# Altium schematic sheet Power-Sheet.SchDoc (part 3 of 3)
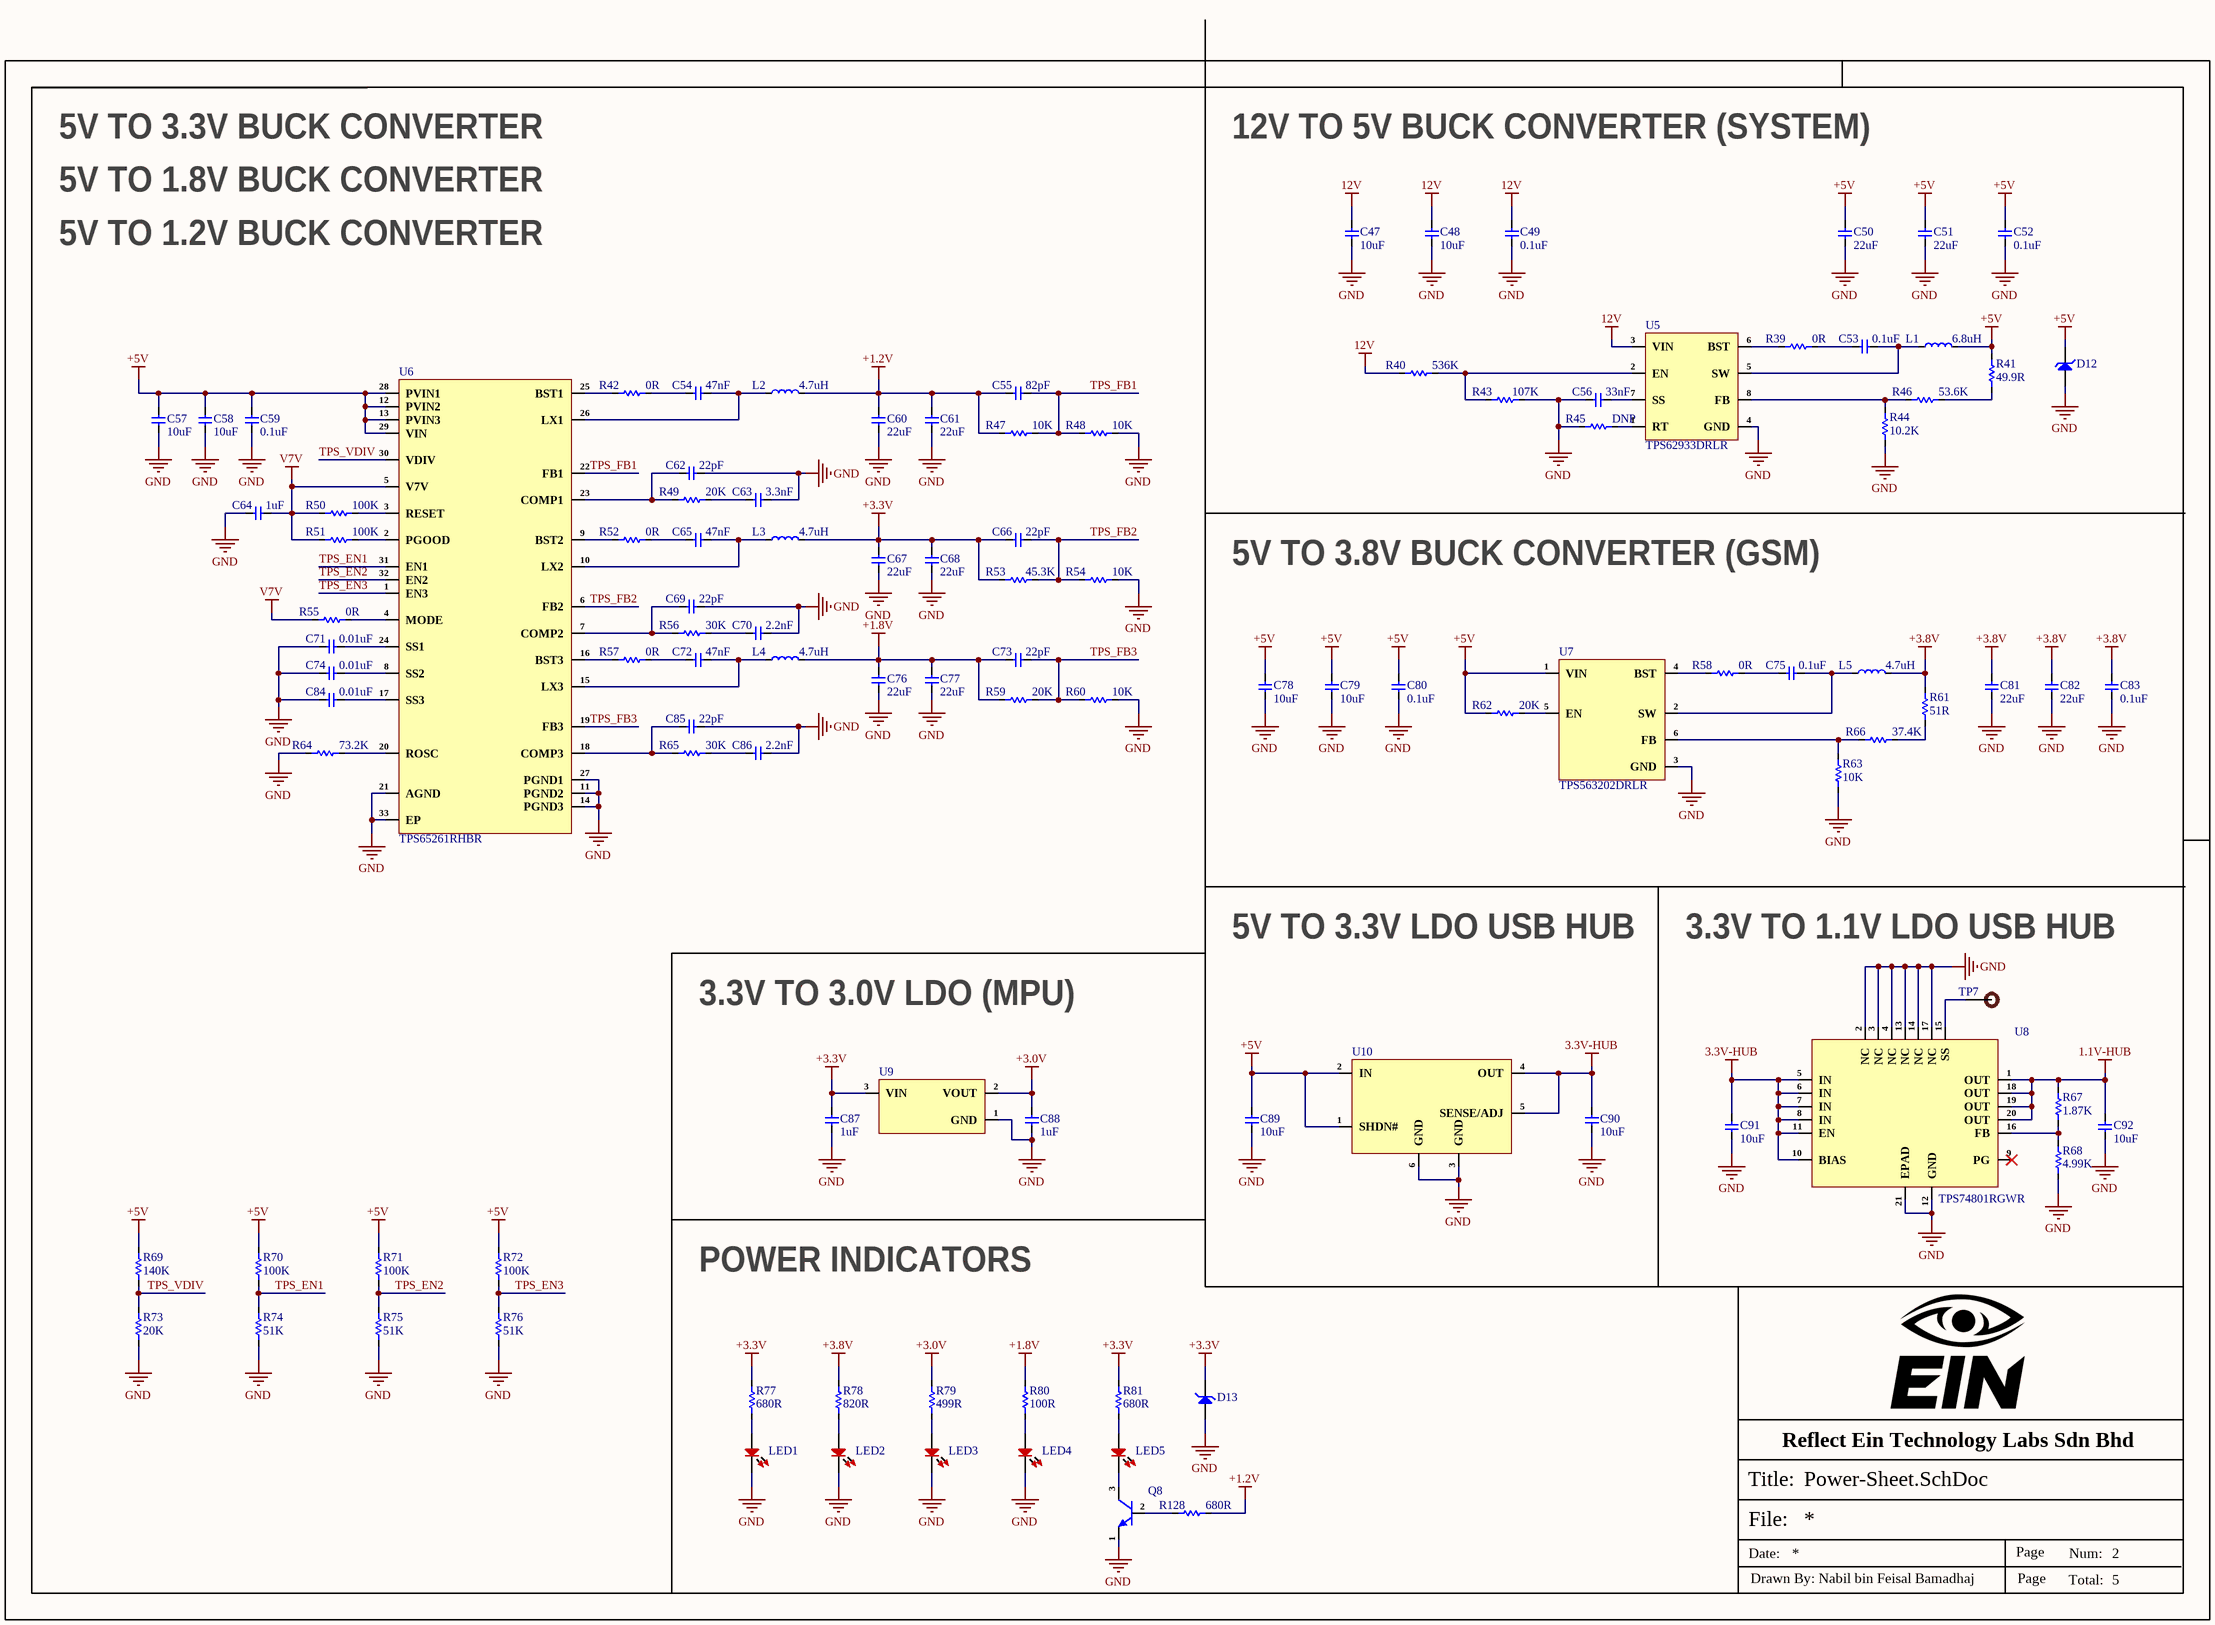
[diagram p2: Power-Sheet.SchDoc]

## Library data of the parts (continued)
R74-R76 = RC0603FR-0751KL: RES 51K OHM 1% 1/10W 0603; Manufacturer: Yageo; Item Type: Resistors; Value: 51kR; Power Rating: 100mW; Voltage Rating: 50V; Temperature Coefficient: 100ppm/°C; Supplier: Future Electronics; LCSC Part Number: C107231; Manufacturer Part Number: RC0603FR-0751KL; RoHS: Yes; Stock: 1155000; Pricing: 5000=0.0024, 50000=0.0023, 150000=0.0022, 375000=0.0021, 1000000=0.002 (USD); Case/Package: 0603; Pins: 2NUMBER; Case Code (Imperial): 0603; Case Code (Metric): 1608; Min Operating Temperature: -55°C; Max Operating Temperature: 155°C; Tolerance: 1%; Packaging: Tape and Reel; Package Quantity: 1; Termination: SMD/SMT; Resistor Type: Thick Film; Number of Terminations: 2; Max Power Dissipation: 100mW; Features: Moisture Resistant; Series: RC; Resistance Tolerance: 1%; Technology: THICK FILM; Voltage Rating (DC): 50V; Length: 1.6mm; Width: 0.031inch; Height: 0.45mm; Depth: 0.8mm; Reach SVHC Compliant: No; RoHS Compliant: Yes; Lead Free: 5697LeadFree; ComponentLink1URL: https://datasheet.ciiva.com/11819/0900766b80f96399-11819378.pdf?src-supplier=Rs; ComponentLink1Description: https://datasheet.ciiva.com/11819/0900766b80f96399-11819378.pdf?src-supplier=Rs; ComponentLink2URL: https://datasheet.ciiva.com/46395/443971-46395014.pdf?src-supplier=Element14; ComponentLink2Description: https://datasheet.ciiva.com/46395/443971-46395014.pdf?src-supplier=Element14; ComponentLink3URL: https://datasheet.ciiva.com/2454/pyu-r-int-thick-7-2454124.pdf?src-supplier=Digikey; ComponentLink3Description: https://datasheet.ciiva.com/2454/pyu-r-int-thick-7-2454124.pdf?src-supplier=Digikey; ComponentLink4URL: https://datasheet.ciiva.com/2454/pyu-r-int-thick-7-2454125.pdf?src-supplier=Digikey; ComponentLink4Description: https://datasheet.ciiva.com/2454/pyu-r-int-thick-7-2454125.pdf?src-supplier=Digikey; ComponentLink5URL: https://datasheet.ciiva.com/2454/pyu-r-int-thick-7-2454123.pdf?src-supplier=Digikey; ComponentLink5Description: https://datasheet.ciiva.com/2454/pyu-r-int-thick-7-2454123.pdf?src-supplier=Digikey; ComponentLink6URL: https://datasheet.ciiva.com/12558/rc0603-272842-12558554.pdf?src-supplier=Mouser; ComponentLink6Description: https://datasheet.ciiva.com/12558/rc0603-272842-12558554.pdf?src-supplier=Mouser
R77 R81 R128 = RC0603FR-07680RL: RES SMD 680 OHM 1% 1/10W 0603; Manufacturer: Yageo; Item Type: Resistor; Manufacturer Part Number: RC0603FR-07680RL; Package: 0603; ComponentLink4URL: https://www.lcsc.com/product-detail/Chip-Resistor-Surface-Mount_YAGEO-RC0603FR-07680RL_C112310.html; ComponentLink4Description: LCSC; LCSC Part Number: C112310
R78 = RC0603FR-07820RL: RES 820 OHM 1% 1/10W 0603; Manufacturer: Yageo; Power Rating: 100mW; Voltage Rating: 75V; Voltage Rating (DC): 50V; Temperature Coefficient: 100ppm/°C; Item Type: Resistor; Supplier 1: Future Electronics; Manufacturer Part Number: RC0603FR-07820RL; RoHS: Yes; Category: Chip SMD Resistors; Stock 1: 415000; Pricing 1: 5000=0.002, 50000=0.0014, 100000=0.0018, 200000=0.0014, 375000=0.0018, 625000=0.0013, 1000000=0.0017, 2000000=0.0012, 3750000=0.0016 (USD); Case/Package: 0603; Pins: 2; Case Code (Imperial): 0603; Case Code (Metric): 1608; Weight: 7.1E-05oz; Min Operating Temperature: -55°C; Max Operating Temperature: 155°C; Tolerance: 1%; Value: 820R; Packaging: Tape and Reel; Termination: SMD/SMT; Resistor Type: Thick Film; Features: Moisture Resistant; Series: RC; Max Power Dissipation: 100mW; Number of Terminations: 2; Construction: Rectangular; Resistance Tolerance: 1%; Technology: THICK FILM; Length: 1.6mm; Width: 0.8mm; Height: 0.45mm; Depth: 0.8mm; Military Standard: Not; Lead Free: Lead Free; RoHS Compliant: Yes; Reach SVHC Compliant: Unknown; ComponentLink1URL: http://www.farnell.com/datasheets/1868787.pdf?src-supplier=Farnell; ComponentLink1Description: http://www.farnell.com/datasheets/1868787.pdf?src-supplier=Farnell; ComponentLink2URL: http://www.mouser.com/ds/2/447/RC0603-272842.pdf?src-supplier=Mouser; ComponentLink2Description: http://www.mouser.com/ds/2/447/RC0603-272842.pdf?src-supplier=Mouser; ComponentLink3URL: http://www.farnell.com/datasheets/2167052.pdf?src-supplier=Farnell; ComponentLink3Description: http://www.farnell.com/datasheets/2167052.pdf?src-supplier=Farnell; ComponentLink4URL: https://www.verical.com/server-webapp/html/getDatasheet?partID=358925&src-supplier=Verical; ComponentLink4Description: https://www.verical.com/server-webapp/html/getDatasheet?partID=358925&src-supplier=Verical; ComponentLink5URL: http://www.farnell.com/datasheets/1868787.pdf?src-supplier=Newark; ComponentLink5Description: http://www.farnell.com/datasheets/1868787.pdf?src-supplier=Newark; ComponentLink6URL: http://www.farnell.com/datasheets/1868787.pdf?src-supplier=Element14; ComponentLink6Description: http://www.farnell.com/datasheets/1868787.pdf?src-supplier=Element14; ComponentLink7URL: http://www.yageo.com/documents/recent/PYu-RC_Group_51_RoHS_L_10.pdf?src-supplier=Digi-Key; ComponentLink7Description: http://www.yageo.com/documents/recent/PYu-RC_Group_51_RoHS_L_10.pdf?src-supplier=Digi-Key; ComponentLink8URL: http://www.yageo.com/documents/recent/PYu-RC_Group_51_RoHS_L_9.pdf?src-supplier=Digi-Key; ComponentLink8Description: http://www.yageo.com/documents/recent/PYu-RC_Group_51_RoHS_L_9.pdf?src-supplier=Digi-Key; ComponentLink9URL: http://www.farnell.com/datasheets/2167052.pdf?src-supplier=Newark; ComponentLink9Description: http://www.farnell.com/datasheets/2167052.pdf?src-supplier=Newark; ComponentLink10URL: http://www.yageo.com/documents/recent/PYu-RC0603_51_RoHS_L_7.pdf?src-supplier=Future+Electronics; ComponentLink10Description: http://www.yageo.com/documents/recent/PYu-RC0603_51_RoHS_L_7.pdf?src-supplier=Future+Electronics; Supplier Part Number 1: 8621260; LCSC Part Number: C114638
R79 = RC0603FR-07499RL: RES 499 OHM 1% 1/10W 0603; Manufacturer: Yageo; Temperature Coefficient: 100ppm/°C; Power Rating: 100mW; Voltage Rating: 50V; Supplier 1: RSComponents; Manufacturer Part Number: RC0603FR-07499RL; RoHS: Yes; Category: Chip SMD Resistors; Stock 1: 900; Pricing 1: 5000=0.00300, 10000=0.00300, 15000=0.00300, 20000=0.00200 (GBP); Mount: Surface Mount; Case/Package: 0603; Contact Plating: Tin,Matte; Case Code (Metric): 1608; Case Code (Imperial): 0603; Size Code: 0603; Min Operating Temperature: -55°C; Max Operating Temperature: 155°C; Resistance: 499R; Tolerance: 1%; Resistor Type: Thick Film; Package Quantity: 1; Packaging: Tape and Reel; Number of Terminations: 2; Termination: SMD/SMT; Max Power Dissipation: 100mW; Voltage Rating (DC): 50V; Features: Moisture Resistant; Series: RC; Construction: Rectangular; Technology: THICK FILM; Length: 1.6mm; Width: 0.031inch; Height: 0.45mm; Depth: 0.8mm; Radiation Hardening: No; Military Standard: Not; Lead Free: Lead Free; RoHS Compliant: Yes; ComponentLink1URL: https://datasheet.ciiva.com/11808/0900766b80f96399-11808558.pdf?src-supplier=RSComponents; ComponentLink1Description: https://datasheet.ciiva.com/11808/0900766b80f96399-11808558.pdf?src-supplier=RSComponents; ComponentLink2URL: https://datasheet.ciiva.com/2453/pyu-r-int-thick-7-2453956.pdf?src-supplier=Digi-Key; ComponentLink2Description: https://datasheet.ciiva.com/2453/pyu-r-int-thick-7-2453956.pdf?src-supplier=Digi-Key; ComponentLink3URL: https://datasheet.ciiva.com/2453/pyu-r-int-thick-7-2453957.pdf?src-supplier=Digi-Key; ComponentLink3Description: https://datasheet.ciiva.com/2453/pyu-r-int-thick-7-2453957.pdf?src-supplier=Digi-Key; ComponentLink4URL: https://datasheet.ciiva.com/2453/pyu-r-int-thick-7-2453955.pdf?src-supplier=Digi-Key; ComponentLink4Description: https://datasheet.ciiva.com/2453/pyu-r-int-thick-7-2453955.pdf?src-supplier=Digi-Key; ComponentLink5URL: https://datasheet.ciiva.com/12558/rc0603-272842-12558391.pdf?src-supplier=Mouser; ComponentLink5Description: https://datasheet.ciiva.com/12558/rc0603-272842-12558391.pdf?src-supplier=Mouser; ComponentLink6URL: https://datasheet.ciiva.com/8885/pyu-rc0603-51-rohs-l-4-8885483.pdf?src-supplier=Avnet; ComponentLink6Description: https://datasheet.ciiva.com/8885/pyu-rc0603-51-rohs-l-4-8885483.pdf?src-supplier=Avnet; Supplier Part Number 1: 1995585; LCSC Part Number: C137714
R80 = RC0603FR-07100RL: RES SMD 100 OHM 1% 1/10W 0603; Manufacturer: Yageo; Temperature Coefficient: 100ppm/°C; Voltage Rating (DC): 50V; Power Rating: 100mW; Item Type: Resistor; Supplier 1: Arrow Electronics; Manufacturer Part Number: RC0603FR-07100RL; RoHS: Yes; Category: Chip SMD Resistors; Stock 1: 3800000; Pricing 1: 5000=0.00300, 5000=0.00200, 5000=0.00450, 50000=0.00410, 500000=0.00230, 2500000=0.00140 (USD); Case/Package: 0603; Number of Pins: 2; Case Code (Imperial): 0603; Case Code (Metric): 1608; Size Code: 0603; Min Operating Temperature: -55°C; Max Operating Temperature: 155°C; Resistance: 100R; Tolerance: 1%; Resistor Type: Thick Film; Packaging: Tape and Reel; Voltage Rating: 50V; Termination: SMD/SMT; Features: Moisture Resistant; Series: RC; Max Power Dissipation: 100mW; Number of Terminations: 2; Construction: Rectangular; Resistance Tolerance: 1%; Technology: THICK FILM; Length: 1.6mm; Width: 0.8mm; Height: 0.45mm; Depth: 0.8mm; REACH SVHC: Unknown; Lead Free: Lead Free; RoHS Compliant: Yes; Military Standard: Not; Supplier Part Number 1: RC0603FR-07100RL; LCSC Part Number: C105588
TP7 = TEST POINT 0.5mm Dia: Test Point ON; Item Type: Test Point; Manufacturer Part Number: TEST POINT 0.5mm Dia
U5 = TPS62933DRLR: IC REG BUCK ADJ 3A SOT583; Manufacturer: Texas Instruments; Supplier: Mouser; Supplier Part Number: 595-TPS62933DRLR; Manufacturer Part Number: TPS62933DRLR; RoHS: No; Category: Voltage Regulators - Switching; Stock: 5259; Pricing: 1=0.7, 10=0.581, 50=0.581, 100=0.44, 1000=0.297, 10000=0.241 (USD); LCSC Part Number: C3200405; Item Type: IC
U6 = TPS65261RHBR: IC REG BCK ADJ 3A/2A TRPL 32VQFN; Manufacturer: Texas Instruments; Supplier: Mouser; LCSC Part Number: C138722; Manufacturer Part Number: TPS65261RHBR; RoHS: Yes; Item Type: IC; Stock: 3449; Pricing: 1=2.78, 10=1.91, 50=1.91, 100=1.71, 1000=1.52, 10000=1.32 (USD); ComponentLink1URL: https://datasheet.ciiva.com/29735/tps65261-1-29735186.pdf?src-supplier=Digikey; ComponentLink1Description: https://datasheet.ciiva.com/29735/tps65261-1-29735186.pdf?src-supplier=Digikey
U7 = TPS563202DRLR: IC REG BUCK ADJ 3A SOT563; Manufacturer: Texas Instruments; Number of Channels: 1NUMBER; Supplier: Mouser; LCSC Part Number: C1513007; Manufacturer Part Number: TPS563202DRLR; RoHS: Yes; Item Type: IC; Stock: 5123; Pricing: 1=0.29, 10=0.174, 50=0.174, 100=0.131, 1000=0.125, 10000=0.109 (USD); Pins: 6NUMBER; Length: 1.6mm; Width: 1.2mm; Height: 600um; Thickness: 550um
U8 = TPS74801RGWR: IC REG LIN POS ADJ 1.5A 20VQFN; Manufacturer: Texas Instruments; Supplier: Mouser; LCSC Part Number: C129193; Manufacturer Part Number: TPS74801RGWR; RoHS: Yes; Item Type: IC; Stock: 12482; Pricing: 1=1.87, 10=1.33, 50=1.33, 100=1.19, 1000=1.04, 10000=1.03 (USD); Length: 5mm; Width: 5mm; Height: 1mm; Thickness: 900um; ComponentLink1URL: https://datasheet.ciiva.com/4885/sbvs074j-203573-4885874.pdf?src-supplier=Mouser; ComponentLink1Description: https://datasheet.ciiva.com/4885/sbvs074j-203573-4885874.pdf?src-supplier=Mouser; ComponentLink2URL: https://datasheet.ciiva.com/41462/001015037-da-01-en-ic-reg-ldo-adj-tps74801rgwr-vqfn-20-tid-41462882.pdf?src-supplier=Conrad; ComponentLink2Description: https://datasheet.ciiva.com/41462/001015037-da-01-en-ic-reg-ldo-adj-tps74801rgwr-vqfn-20-tid-41462882.pdf?src-supplier=Conrad; ComponentLink3URL: https://datasheet.ciiva.com/14278/tps74801-14278399.pdf?src-supplier=Avnet; ComponentLink3Description: https://datasheet.ciiva.com/14278/tps74801-14278399.pdf?src-supplier=Avnet; ComponentLink4URL: https://datasheet.ciiva.com/31402/tps74801-31402076.pdf?src-supplier=Farnell; ComponentLink4Description: https://datasheet.ciiva.com/31402/tps74801-31402076.pdf?src-supplier=Farnell; ComponentLink5URL: https://datasheet.ciiva.com/2044/tps74801-2044836.pdf?src-supplier=Digikey; ComponentLink5Description: https://datasheet.ciiva.com/2044/tps74801-2044836.pdf?src-supplier=Digikey; ComponentLink6URL: https://datasheet.ciiva.com/2044/tps74801-2044837.pdf?src-supplier=Digikey; ComponentLink6Description: https://datasheet.ciiva.com/2044/tps74801-2044837.pdf?src-supplier=Digikey; ComponentLink7URL: https://datasheet.ciiva.com/2044/tps74801-2044838.pdf?src-supplier=Digikey; ComponentLink7Description: https://datasheet.ciiva.com/2044/tps74801-2044838.pdf?src-supplier=Digikey
U9 = XC6206P302MR-G: IC REG LINEAR 3V 200MA SOT23; Manufacturer: Torex; Number of Channels: 1NUMBER; Supplier: Mouser; LCSC Part Number: C9972; Manufacturer Part Number: XC6206P302MR-G; RoHS: Yes; Item Type: IC; Stock: 15826; Pricing: 1=0.68, 10=0.543, 50=0.543, 100=0.417, 1000=0.271, 10000=0.214 (USD); Output Voltage: 3V; ComponentLink1URL: https://www.torexsemi.com/file/xc6206/XC6206.pdf?src-supplier=Digikey; ComponentLink1Description: https://www.torexsemi.com/file/xc6206/XC6206.pdf?src-supplier=Digikey; ComponentLink2URL: https://datasheet.octopart.com/XC6206P302MR-G-Torex-datasheet-134531119.pdf?src-supplier=TME; ComponentLink2Description: https://datasheet.octopart.com/XC6206P302MR-G-Torex-datasheet-134531119.pdf?src-supplier=TME
U10 = TPS7A4533DCQR: IC REG LINEAR 3.3V 1.5A SOT223-6; Manufacturer: Texas Instruments; Dropout Voltage: 300mV; Number of Outputs: 1; Max Supply Voltage: 20V; Min Input Voltage: 2.1V; Min Current Limit: 1.6A; Input Bias Current: 1mA; Polarity: Positive; Accuracy: 1%; Output Type: Fixed; Supplier: Mouser; LCSC Part Number: 595-TPS7A4533DCQR; Manufacturer Part Number: TPS7A4533DCQR; RoHS: Yes; Item Type: IC; Stock: 854; Pricing: 1=3.2, 10=2.35, 50=2.35, 100=2.14, 1000=2, 10000=1.87 (USD); Case/Package: SOT-223-6; Pins: 6; Min Operating Temperature: -40°C; Max Operating Temperature: 125°C; Output Voltage: 3.3V; Package Quantity: 2500; Packaging: Tape and Reel; Output Current: 1.5A; Max Output current: 1.5A; Number of Regulators: 1; Quiescent Current: 1mA; Max Output Voltage: 3.3V; Min Output Voltage: 3.3V; Series: -; Radiation Hardening: No; Lead Free: Lead Free; RoHS Compliant: Yes; ComponentLink1URL: https://datasheet.ciiva.com/2046/tps7a4515-2046240.pdf?src-supplier=Digikey; ComponentLink1Description: https://datasheet.ciiva.com/2046/tps7a4515-2046240.pdf?src-supplier=Digikey; ComponentLink2URL: https://datasheet.ciiva.com/29569/tps7a4501-29569717.pdf?src-supplier=Digikey; ComponentLink2Description: https://datasheet.ciiva.com/29569/tps7a4501-29569717.pdf?src-supplier=Digikey; ComponentLink3URL: https://datasheet.ciiva.com/29569/tps7a4501-29569718.pdf?src-supplier=Digikey; ComponentLink3Description: https://datasheet.ciiva.com/29569/tps7a4501-29569718.pdf?src-supplier=Digikey; ComponentLink4URL: https://datasheet.ciiva.com/29569/tps7a4501-29569719.pdf?src-supplier=Digikey; ComponentLink4Description: https://datasheet.ciiva.com/29569/tps7a4501-29569719.pdf?src-supplier=Digikey